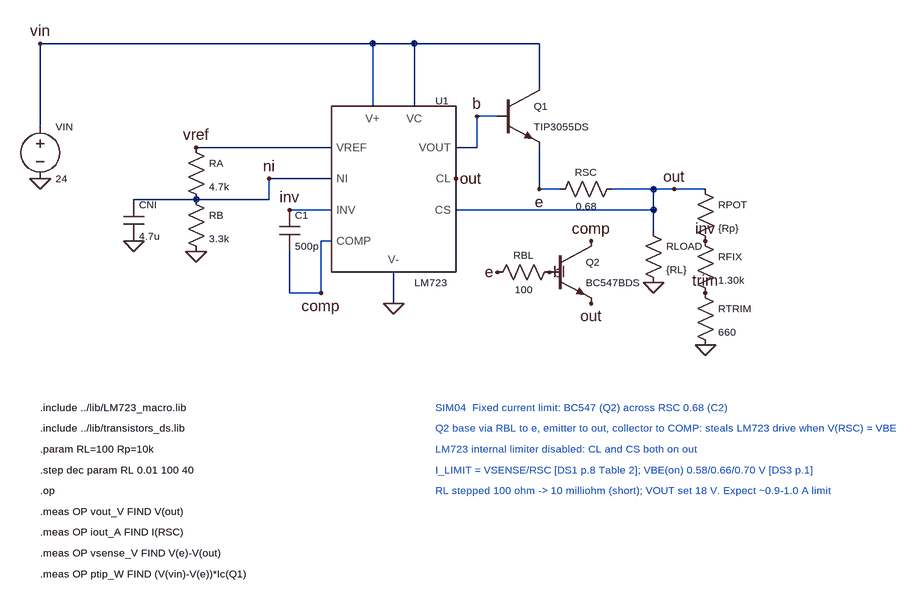
[diagram p0: schematic SIM04_fixed_current_limit.asc]
SIM04_fixed_current_limit.asc, the LTspice schematic file:
Version 4
SHEET 1 1500 1100
WIRE 96 304 96 176
WIRE 96 176 864 176
WIRE 608 176 608 272
WIRE 672 176 672 272
WIRE 864 176 864 240
WIRE 640 528 640 576
WIRE 544 336 336 336
WIRE 336 416 448 416
WIRE 448 416 448 384
WIRE 448 384 544 384
WIRE 240 416 336 416
WIRE 544 432 480 432
WIRE 544 480 528 480
WIRE 528 480 528 560
WIRE 528 560 480 560
WIRE 480 560 480 496
WIRE 736 336 768 336
WIRE 768 336 768 288
WIRE 768 288 800 288
WIRE 864 336 864 400
WIRE 864 400 896 400
WIRE 976 400 1120 400
WIRE 736 432 1040 432
WIRE 1040 432 1040 400
WIRE 1040 432 1040 464
FLAG 96 384 0
FLAG 640 576 0
FLAG 336 496 0
FLAG 240 480 0
FLAG 96 176 vin
FLAG 336 336 vref
FLAG 448 384 ni
FLAG 480 432 inv
FLAG 528 560 comp
FLAG 768 288 b
FLAG 736 384 out
FLAG 864 400 e
FLAG 1072 400 out
FLAG 1040 544 0
FLAG 944 480 comp
FLAG 944 576 out
FLAG 800 528 e
FLAG 880 528 bl
FLAG 1120 480 inv
FLAG 1120 560 trim
FLAG 1120 640 0
SYMBOL voltage 96 288 R0
WINDOW 0 24 16 Left 1
WINDOW 3 24 96 Left 1
SYMATTR InstName VIN
SYMATTR Value 24
SYMBOL LM723 640 400 R0
WINDOW 0 64 -136 Left 1
WINDOW 3 32 144 Left 1
SYMATTR InstName U1
SYMBOL npn 800 240 R0
WINDOW 0 56 32 Left 1
WINDOW 3 56 64 Left 1
SYMATTR InstName Q1
SYMATTR Value TIP3055DS
SYMBOL res 320 320 R0
WINDOW 0 36 40 Left 1
WINDOW 3 36 76 Left 1
SYMATTR InstName RA
SYMATTR Value 4.7k
SYMBOL res 320 400 R0
WINDOW 0 36 40 Left 1
WINDOW 3 36 76 Left 1
SYMATTR InstName RB
SYMATTR Value 3.3k
SYMBOL cap 224 416 R0
WINDOW 0 24 8 Left 1
WINDOW 3 24 56 Left 1
SYMATTR InstName CNI
SYMATTR Value 4.7u
SYMBOL cap 464 432 R0
WINDOW 0 24 8 Left 1
WINDOW 3 24 56 Left 1
SYMATTR InstName C1
SYMATTR Value 500p
SYMBOL res 992 384 R90
WINDOW 0 0 56 VBottom 1
WINDOW 3 32 56 VTop 1
SYMATTR InstName RSC
SYMATTR Value 0.68
SYMBOL res 1024 448 R0
WINDOW 0 36 40 Left 1
WINDOW 3 36 76 Left 1
SYMATTR InstName RLOAD
SYMATTR Value {RL}
SYMBOL npn 880 480 R0
WINDOW 0 56 32 Left 1
WINDOW 3 56 64 Left 1
SYMATTR InstName Q2
SYMATTR Value BC547BDS
SYMBOL res 896 512 R90
WINDOW 0 0 56 VBottom 1
WINDOW 3 32 56 VTop 1
SYMATTR InstName RBL
SYMATTR Value 100
SYMBOL res 1104 384 R0
WINDOW 0 36 40 Left 1
WINDOW 3 36 76 Left 1
SYMATTR InstName RPOT
SYMATTR Value {Rp}
SYMBOL res 1104 464 R0
WINDOW 0 36 40 Left 1
WINDOW 3 36 76 Left 1
SYMATTR InstName RFIX
SYMATTR Value 1.30k
SYMBOL res 1104 544 R0
WINDOW 0 36 40 Left 1
WINDOW 3 36 76 Left 1
SYMATTR InstName RTRIM
SYMATTR Value 660
TEXT 96 736 Left 1 !.include ../lib/LM723_macro.lib
TEXT 96 768 Left 1 !.include ../lib/transistors_ds.lib
TEXT 96 800 Left 1 !.param RL=100 Rp=10k
TEXT 96 832 Left 1 !.step dec param RL 0.01 100 40
TEXT 96 864 Left 1 !.op
TEXT 96 896 Left 1 !.meas OP vout_V FIND V(out)
TEXT 96 928 Left 1 !.meas OP iout_A FIND I(RSC)
TEXT 96 960 Left 1 !.meas OP vsense_V FIND V(e)-V(out)
TEXT 96 992 Left 1 !.meas OP ptip_W FIND (V(vin)-V(e))*Ic(Q1)
TEXT 704 736 Left 1 ;SIM04  Fixed current limit: BC547 (Q2) across RSC 0.68 (C2)
TEXT 704 768 Left 1 ;Q2 base via RBL to e, emitter to out, collector to COMP: steals LM723 drive when V(RSC) = VBE
TEXT 704 800 Left 1 ;LM723 internal limiter disabled: CL and CS both on out
TEXT 704 832 Left 1 ;I_LIMIT = VSENSE/RSC [DS1 p.8 Table 2]; VBE(on) 0.58/0.66/0.70 V [DS3 p.1]
TEXT 704 864 Left 1 ;RL stepped 100 ohm -> 10 milliohm (short); VOUT set 18 V. Expect ~0.9-1.0 A limit

The netlist it stands for:
* SIM04_fixed_current_limit.asc
VIN vin 0 24
XU1 vin 0 vin b vref ni inv comp out out LM723  ; pins V+ V- VC VOUT VREF NI INV COMP CL CS
Q1 vin b e 0 TIP3055DS
RA vref ni 4.7k
RB ni 0 3.3k
CNI ni 0 4.7u
C1 inv comp 500p
RSC out e 0.68
RLOAD out 0 {RL}
Q2 comp bl out 0 BC547BDS
RBL bl e 100
RPOT out inv {Rp}
RFIX inv trim 1.30k
RTRIM trim 0 660
.model NPN NPN
.model PNP PNP
.lib standard.bjt
.include ../lib/LM723_macro.lib
.include ../lib/transistors_ds.lib
.param RL=100 Rp=10k
.step dec param RL 0.01 100 40
.op
.meas OP vout_V FIND V(out)
.meas OP iout_A FIND I(RSC)
.meas OP vsense_V FIND V(e)-V(out)
.meas OP ptip_W FIND (V(vin)-V(e))*Ic(Q1)
* SIM04  Fixed current limit: BC547 (Q2) across RSC 0.68 (C2)
* Q2 base via RBL to e, emitter to out, collector to COMP: steals LM723 drive when V(RSC) = VBE
* LM723 internal limiter disabled: CL and CS both on out
* I_LIMIT = VSENSE/RSC [DS1 p.8 Table 2]; VBE(on) 0.58/0.66/0.70 V [DS3 p.1]
* RL stepped 100 ohm -> 10 milliohm (short); VOUT set 18 V. Expect ~0.9-1.0 A limit
.backanno
.end